# Altium schematic sheet AMPLIFIER_SHEET.SchDoc
size A; SheetNumber: 6; SheetTotal: 9
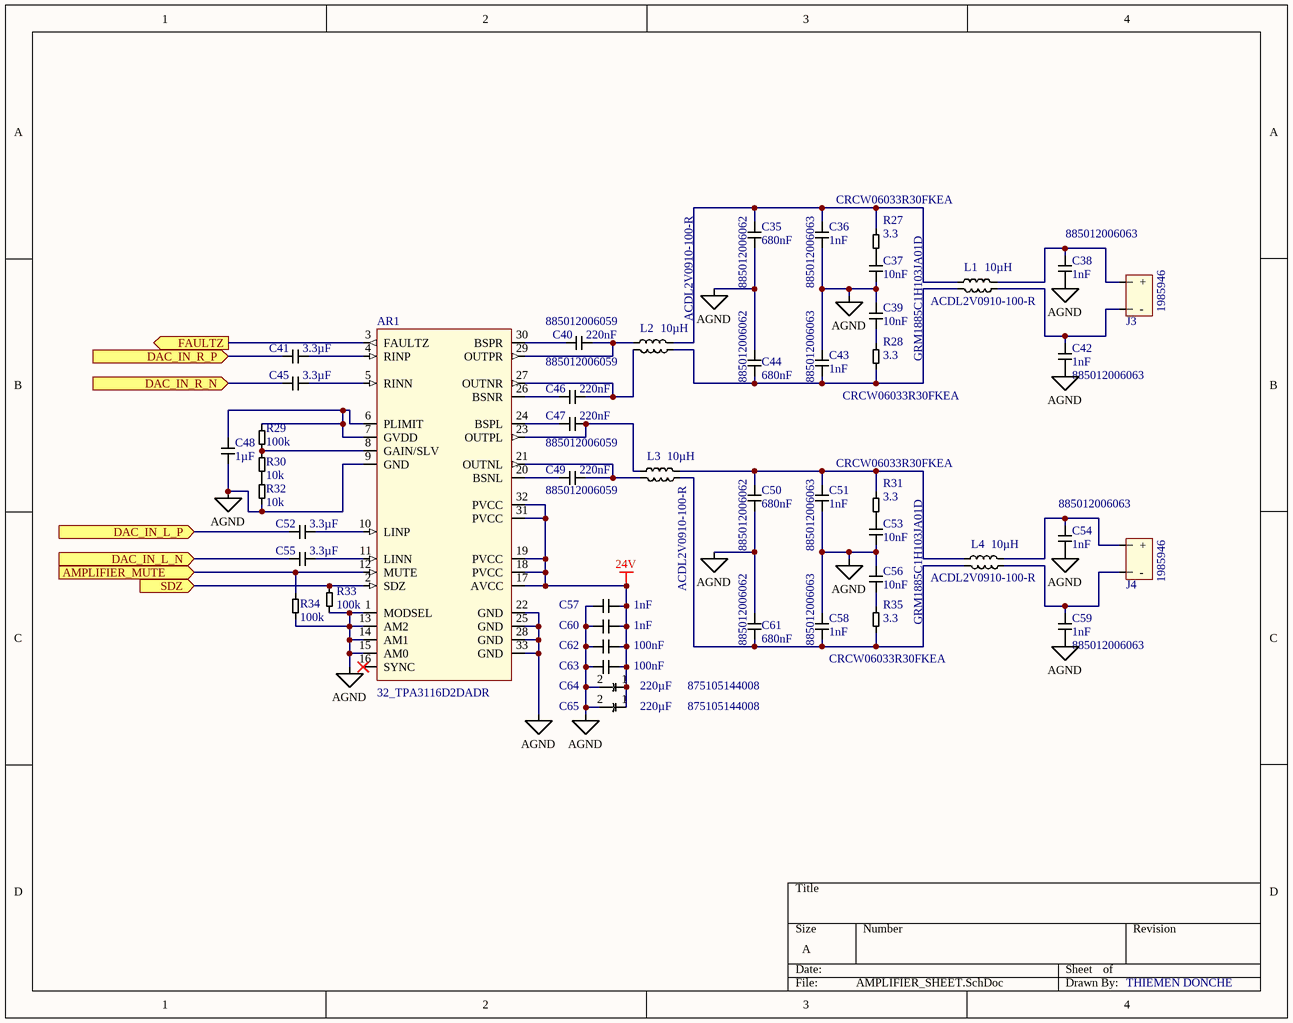
[diagram p0: AMPLIFIER_SHEET.SchDoc]

## Parts
AR1  32_TPA3116D2DADR  [TSSOP-32+G_TPA3116D2DADR]
C35  680nF  type: 885012006062  [0603_SMD_CAP]
C36  1nF  type: 885012006063  [0603_SMD_CAP]
C37  10nF  type: GRM1885C1H103JA01D  [0603_SMD_CAP]
C38  1nF  type: 885012006063  [0603_SMD_CAP]
C39  10nF  [0603_SMD_CAP]
C40  220nF  type: 885012006059  [0603_SMD_CAP]
C41  3.3µF  [0603_SMD_CAP]
C42  1nF  type: 885012006063  [0603_SMD_CAP]
C43  1nF  type: 885012006063  [0603_SMD_CAP]
C44  680nF  type: 885012006062  [0603_SMD_CAP]
C45  3.3µF  [0603_SMD_CAP]
C46  220nF  type: 885012006059  [0603_SMD_CAP]
C47  220nF  type: 885012006059  [0603_SMD_CAP]
C48  1µF  [0603_SMD_CAP]
C49  220nF  type: 885012006059  [0603_SMD_CAP]
C50  680nF  type: 885012006062  [0603_SMD_CAP]
C51  1nF  type: 885012006063  [0603_SMD_CAP]
C52  3.3µF  [0603_SMD_CAP]
C53  10nF  [0603_SMD_CAP]
C54  1nF  type: 885012006063  [0603_SMD_CAP]
C55  3.3µF  [0603_SMD_CAP]
C56  10nF  type: GRM1885C1H103JA01D  [0603_SMD_CAP]
C57  1nF  [0603_SMD_CAP]
C58  1nF  type: 885012006063  [0603_SMD_CAP]
C59  1nF  type: 885012006063  [0603_SMD_CAP]
C60  1nF  [0603_SMD_CAP]
C61  680nF  type: 885012006062  [0603_SMD_CAP]
C62  100nF  [0603_SMD_CAP]
C63  100nF  [0603_SMD_CAP]
C64  220µF  type: 875105144008  [4.0-5.5_ELCO-CAP]
C65  220µF  type: 875105144008  [4.0-5.5_ELCO-CAP]
J3  type: 1985946  [2_FIXED-TERMINAL]  (hidden comment: 2P_connector)
J4  type: 1985946  [2_FIXED-TERMINAL]  (hidden comment: 2P_connector)
L1  10µH  type: ACDL2V0910-100-R  [DFN-4_ ACDL2V0910-100-R]
L2  10µH  type: ACDL2V0910-100-R  [DFN-4_ ACDL2V0910-100-R]
L3  10µH  type: ACDL2V0910-100-R  [DFN-4_ ACDL2V0910-100-R]
L4  10µH  type: ACDL2V0910-100-R  [DFN-4_ ACDL2V0910-100-R]
R27  3.3  type: CRCW06033R30FKEA  [0603_SMD_PACKAGE]
R28  3.3  type: CRCW06033R30FKEA  [0603_SMD_PACKAGE]
R29  100k  [0603_SMD_PACKAGE]
R30  10k  [0201_SMD_FOOTPRINT]
R31  3.3  type: CRCW06033R30FKEA  [0603_SMD_PACKAGE]
R32  10k  [0201_SMD_FOOTPRINT]
R33  100k  [0603_SMD_PACKAGE]
R34  100k  [0603_SMD_PACKAGE]
R35  3.3  type: CRCW06033R30FKEA  [0603_SMD_PACKAGE]

## Ports
AMPLIFIER_MUTE (in, see TOP_SHEET[3C], ADAU_PERIPHERALS[3B]), DAC_IN_L_N (in, see TOP_SHEET[3C]), DAC_IN_L_P (in, see TOP_SHEET[3C]), DAC_IN_R_N (in, see TOP_SHEET[3C]), DAC_IN_R_P (in, see TOP_SHEET[3C]), FAULTZ (out, see TOP_SHEET[3C], ESP_SHEET[1C]), SDZ (in, see TOP_SHEET[3C], ESP_SHEET[1C])

## Nets
24V: AR1.17(AVCC) AR1.18(PVCC) AR1.19(PVCC) AR1.31(PVCC) AR1.32(PVCC) C57.2 C60.2 C62.2 C63.2 C64.1 C65.1
AGND: AR1.1(MODSEL) AR1.9(GND) AR1.13(AM2) AR1.14(AM1) AR1.15(AM0) AR1.22(GND) AR1.25(GND) AR1.28(GND) AR1.33(GND) C35.1 C36.1 C37.1 C38.1 C39.2 C42.1 C43.2 C44.2 C48.1 C50.1 C51.1 C53.1 C54.1 C56.2 C57.1 C58.2 C59.1 C60.1 C61.2 C62.1 C63.1 C64.2 C65.2 R32.1 R33.2 R34.2
AMPLIFIER_MUTE: AR1.12(MUTE) R34.1 ; port AMPLIFIER_MUTE
DAC_IN_L_N: C55.1 ; port DAC_IN_L_N
DAC_IN_L_P: C52.1 ; port DAC_IN_L_P
DAC_IN_R_N: C45.1 ; port DAC_IN_R_N
DAC_IN_R_P: C41.1 ; port DAC_IN_R_P
FAULTZ: AR1.3(FAULTZ) ; port FAULTZ
SDZ: AR1.2(SDZ) R33.1 ; port SDZ
NetAR1_4: AR1.4(RINP) C41.2
NetAR1_5: AR1.5(RINN) C45.2
NetAR1_6: AR1.6(PLIMIT) AR1.7(GVDD) C48.2 R29.2
NetAR1_8: AR1.8(GAIN/SLV) R29.1 R30.2
NetAR1_10: AR1.10(LINP) C52.2
NetAR1_11: AR1.11(LINN) C55.2
NetAR1_20: AR1.20(BSNL) C49.1
NetAR1_21: AR1.21(OUTNL) C49.2 L3.3
NetAR1_23: AR1.23(OUTPL) C47.2 L3.1
NetAR1_24: AR1.24(BSPL) C47.1
NetAR1_26: AR1.26(BSNR) C46.1
NetAR1_27: AR1.27(OUTNR) C46.2 L2.3
NetAR1_29: AR1.29(OUTPR) C40.2 L2.1
NetAR1_30: AR1.30(BSPR) C40.1
NetC35_2: C35.2 C36.2 L1.1 L2.2 R27.2
NetC37_2: C37.2 R27.1
NetC38_2: C38.2 J3.1(+) L1.2
NetC39_1: C39.1 R28.2
NetC42_2: C42.2 J3.2(-) L1.4
NetC43_1: C43.1 C44.1 L1.3 L2.4 R28.1
NetC50_2: C50.2 C51.2 L3.2 L4.1 R31.2
NetC53_2: C53.2 R31.1
NetC54_2: C54.2 J4.1(+) L4.2
NetC56_1: C56.1 R35.2
NetC58_1: C58.1 C61.1 L3.4 L4.3 R35.1
NetC59_2: C59.2 J4.2(-) L4.4
NetR30_1: R30.1 R32.2

Not connected (* = marked no-connect by the designer): AR1 16(SYNC)*

## Notes on the sheet
- THIEMEN DONCHE

## Library data of the parts
AR1 = 32_TPA3116D2DADR: class-D,50W,THD+N=0.1,4.5V-26V; Supplier 1: Arrow Electronics; Supplier Part Number 1: TPA3116D2DADR
C35-C63 = ceramic capacator
  C39 C41 C45 C48 C52 C53 C55 C57 C60 C62 C63: type: *
C64 C65 = electrolitische condensator: Supplier 1: Farnell; Supplier Part Number 1: 865090640005
L1-L4 = duo_inductor: Supplier 1: Farnell; Supplier Part Number 1: ACDL2V0910-100-R
R27-R35 = resistor
  R29 R30 R32-R34: type: *